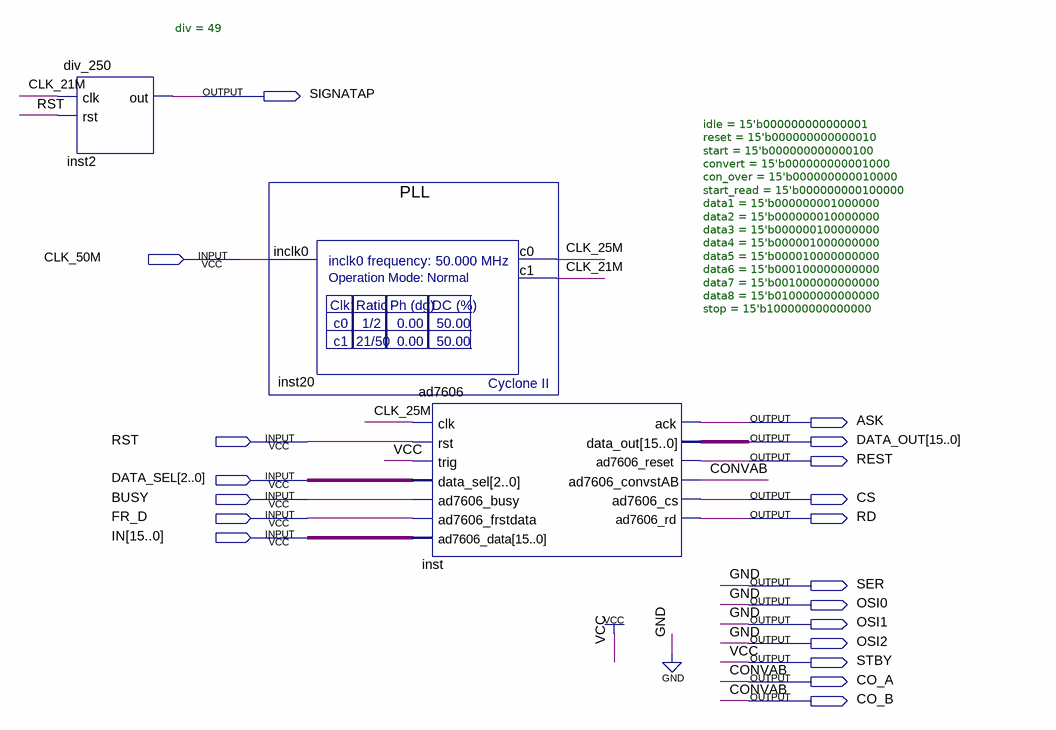
[diagram p0: schematic sheet]
// Quartus schematic 7606.bdf as structural Verilog: 3 symbols, 19 pins
module \7606  (
  input  CLK_50M,
  input  RST,
  input  [2:0] DATA_SEL,
  input  BUSY,
  input  FR_D,
  input  [15:0] IN,
  output SIGNATAP,
  output ASK,
  output [15:0] DATA_OUT,
  output REST,
  output CS,
  output RD,
  output SER,
  output OSI0,
  output OSI1,
  output OSI2,
  output STBY,
  output CO_A,
  output CO_B
);

  wire CLK_21M, CLK_25M;

  div_250 #(.div(49)) inst2 (.clk(CLK_21M), .rst(RST), .out(SIGNATAP));
  PLL inst20 (.inclk0(CLK_50M), .c0(CLK_25M), .c1(CLK_21M));
  ad7606 #(.idle(15'b000000000000001), .reset(15'b000000000000010), .start(15'b000000000000100), .convert(15'b000000000001000), .con_over(15'b000000000010000), .start_read(15'b000000000100000), .data1(15'b000000001000000), .data2(15'b000000010000000), .data3(15'b000000100000000), .data4(15'b000001000000000), .data5(15'b000010000000000), .data6(15'b000100000000000), .data7(15'b001000000000000), .data8(15'b010000000000000), .stop(15'b100000000000000)) inst (
    .clk(CLK_25M), .rst(RST), .trig(1'b1), .data_sel(DATA_SEL), .ad7606_busy(BUSY), .ad7606_frstdata(FR_D),
    .ad7606_data(IN), .ack(ASK), .data_out(DATA_OUT), .ad7606_reset(REST), .ad7606_convstAB(CO_A),
    .ad7606_cs(CS), .ad7606_rd(RD));

  assign CO_B = CO_A;
  assign OSI0 = 1'b0;
  assign OSI1 = 1'b0;
  assign OSI2 = 1'b0;
  assign SER = 1'b0;
  assign STBY = 1'b1;

  // Other names for the same wires on the sheet: CONVAB = CO_A
endmodule
